# Altium schematic sheet buttons.SchDoc
size A4
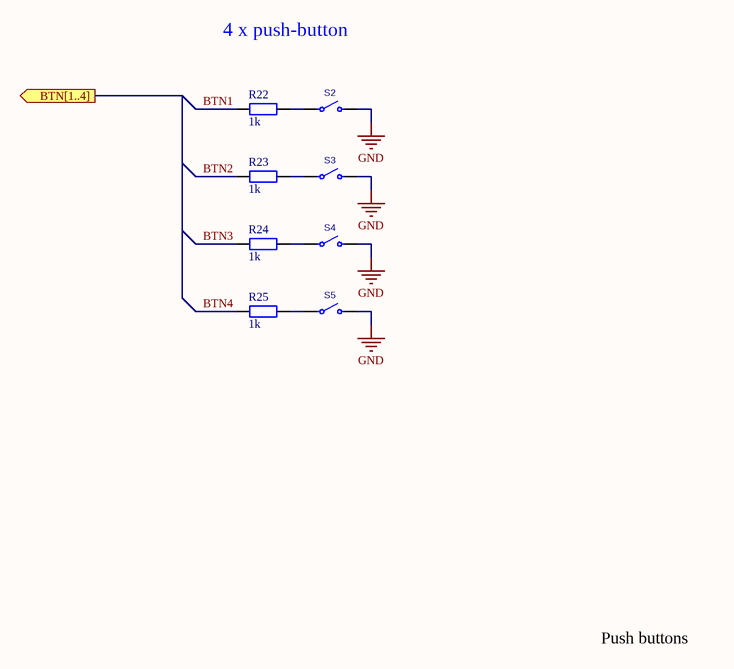
[diagram p0: buttons.SchDoc]

## Parts
R22  1k  [R_0805]
R23  1k  [R_0805]
R24  1k  [R_0805]
R25  1k  [R_0805]
S2  (no value)  [PUSH BUTTON 6x6 mm]
S3  (no value)  [PUSH BUTTON 6x6 mm]
S4  (no value)  [PUSH BUTTON 6x6 mm]
S5  (no value)  [PUSH BUTTON 6x6 mm]

## Ports
BTN[1..4] (out)

## Nets
GND: S2.2 S3.2 S4.2 S5.2
BTN1: R22.1
BTN2: R23.1
BTN3: R24.1
BTN4: R25.1
NetR22_2: R22.2 S2.1
NetR23_2: R23.2 S3.1
NetR24_2: R24.2 S4.1
NetR25_2: R25.2 S5.1

## Notes on the sheet
- 4 x push-button
- Push buttons

## Library data of the parts
R22-R25 = Resistor: Generic resistor; Value: 1k
S2-S5 = Push button: Generic push button